# Altium schematic sheet FPGA_J3_J4.SchDoc
size A3; SheetNumber: 2; SheetTotal: 18
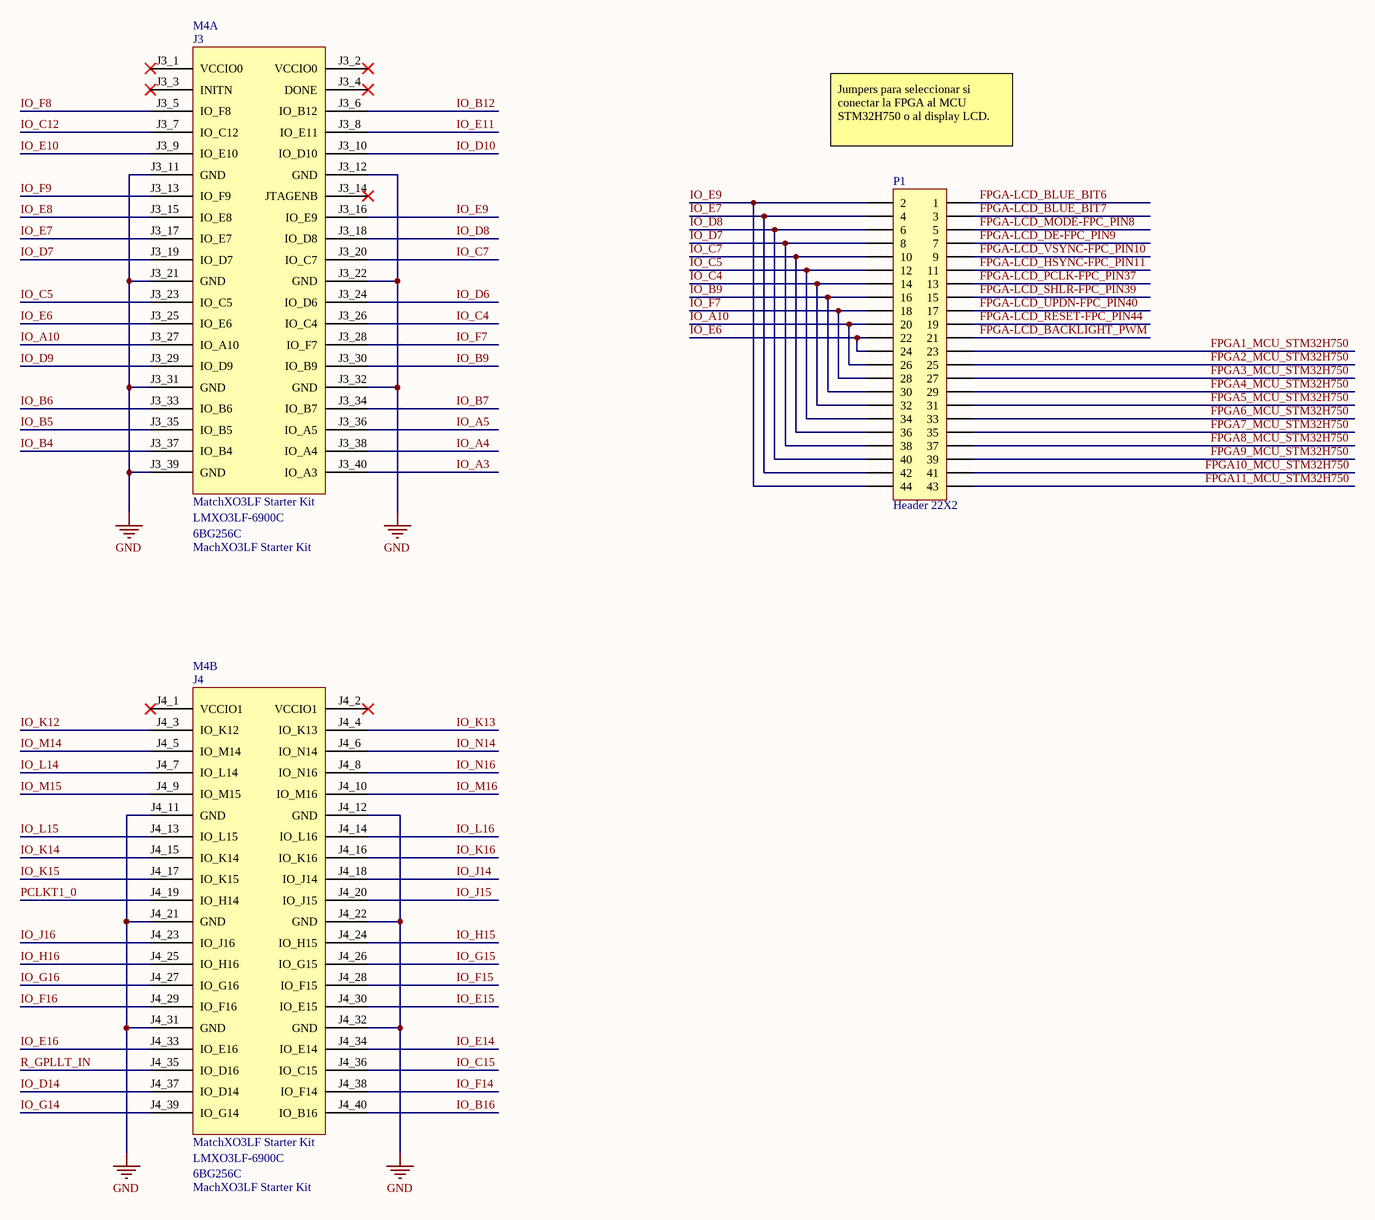
[diagram p0: FPGA_J3_J4.SchDoc]

## Parts
M4  MachXO3LF Starter Kit  [Lattice MachXO3LF starter kit]  (parts A,B of 4)
P1  Header 22X2  [HDR2X22]

## Nets
GND: M4.J3_11(GND) M4.J3_12(GND) M4.J3_21(GND) M4.J3_22(GND) M4.J3_31(GND) M4.J3_32(GND) M4.J3_39(GND) M4.J4_11(GND) M4.J4_12(GND) M4.J4_21(GND) M4.J4_22(GND) M4.J4_31(GND) M4.J4_32(GND)
FPGA1_MCU_STM32H750: P1.23
FPGA2_MCU_STM32H750: P1.25
FPGA3_MCU_STM32H750: P1.27
FPGA4_MCU_STM32H750: P1.29
FPGA5_MCU_STM32H750: P1.31
FPGA6_MCU_STM32H750: P1.33
FPGA7_MCU_STM32H750: P1.35
FPGA8_MCU_STM32H750: P1.37
FPGA9_MCU_STM32H750: P1.39
FPGA10_MCU_STM32H750: P1.41
FPGA11_MCU_STM32H750: P1.43
FPGA-LCD_BACKLIGHT_PWM: P1.21
FPGA-LCD_BLUE_BIT6: P1.1
FPGA-LCD_BLUE_BIT7: P1.3
FPGA-LCD_DE-FPC_PIN9: P1.7
FPGA-LCD_HSYNC-FPC_PIN11: P1.11
FPGA-LCD_MODE-FPC_PIN8: P1.5
FPGA-LCD_PCLK-FPC_PIN37: P1.13
FPGA-LCD_RESET-FPC_PIN44: P1.19
FPGA-LCD_SHLR-FPC_PIN39: P1.15
FPGA-LCD_UPDN-FPC_PIN40: P1.17
FPGA-LCD_VSYNC-FPC_PIN10: P1.9
IO_A3: M4.J3_40(IO_A3)
IO_A4: M4.J3_38(IO_A4)
IO_A5: M4.J3_36(IO_A5)
IO_A10: M4.J3_27(IO_A10) P1.20 P1.26
IO_B4: M4.J3_37(IO_B4)
IO_B5: M4.J3_35(IO_B5)
IO_B6: M4.J3_33(IO_B6)
IO_B7: M4.J3_34(IO_B7)
IO_B9: M4.J3_30(IO_B9) P1.16 P1.30
IO_B12: M4.J3_6(IO_B12)
IO_B16: M4.J4_40(IO_B16)
IO_C4: M4.J3_26(IO_C4) P1.14 P1.32
IO_C5: M4.J3_23(IO_C5) P1.12 P1.34
IO_C7: M4.J3_20(IO_C7) P1.10 P1.36
IO_C12: M4.J3_7(IO_C12)
IO_C15: M4.J4_36(IO_C15)
IO_D6: M4.J3_24(IO_D6)
IO_D7: M4.J3_19(IO_D7) P1.8 P1.38
IO_D8: M4.J3_18(IO_D8) P1.6 P1.40
IO_D9: M4.J3_29(IO_D9)
IO_D10: M4.J3_10(IO_D10)
IO_D14: M4.J4_37(IO_D14)
IO_E6: M4.J3_25(IO_E6) P1.22 P1.24
IO_E7: M4.J3_17(IO_E7) P1.4 P1.42
IO_E8: M4.J3_15(IO_E8)
IO_E9: M4.J3_16(IO_E9) P1.2 P1.44
IO_E10: M4.J3_9(IO_E10)
IO_E11: M4.J3_8(IO_E11)
IO_E14: M4.J4_34(IO_E14)
IO_E15: M4.J4_30(IO_E15)
IO_E16: M4.J4_33(IO_E16)
IO_F7: M4.J3_28(IO_F7) P1.18 P1.28
IO_F8: M4.J3_5(IO_F8)
IO_F9: M4.J3_13(IO_F9)
IO_F14: M4.J4_38(IO_F14)
IO_F15: M4.J4_28(IO_F15)
IO_F16: M4.J4_29(IO_F16)
IO_G14: M4.J4_39(IO_G14)
IO_G15: M4.J4_26(IO_G15)
IO_G16: M4.J4_27(IO_G16)
IO_H15: M4.J4_24(IO_H15)
IO_H16: M4.J4_25(IO_H16)
IO_J14: M4.J4_18(IO_J14)
IO_J15: M4.J4_20(IO_J15)
IO_J16: M4.J4_23(IO_J16)
IO_K12: M4.J4_3(IO_K12)
IO_K13: M4.J4_4(IO_K13)
IO_K14: M4.J4_15(IO_K14)
IO_K15: M4.J4_17(IO_K15)
IO_K16: M4.J4_16(IO_K16)
IO_L14: M4.J4_7(IO_L14)
IO_L15: M4.J4_13(IO_L15)
IO_L16: M4.J4_14(IO_L16)
IO_M14: M4.J4_5(IO_M14)
IO_M15: M4.J4_9(IO_M15)
IO_M16: M4.J4_10(IO_M16)
IO_N14: M4.J4_6(IO_N14)
IO_N16: M4.J4_8(IO_N16)
PCLKT1_0: M4.J4_19(IO_H14)
R_GPLLT_IN: M4.J4_35(IO_D16)

Not connected (* = marked no-connect by the designer): M4 J3_1(VCCIO0)* J3_2(VCCIO0)* J3_3(INITN)* J3_4(DONE)* J3_14(JTAGENB)* J4_1(VCCIO1)* J4_2(VCCIO1)*

## Notes on the sheet
- Jumpers para seleccionar si conectar la FPGA al MCU STM32H750 o al display LCD.
- (in symbol Lattice_MachXO3LF_starter_kit, part A) J3; MatchXO3LF Starter Kit; LMXO3LF-6900C; 6BG256C
- (in symbol Lattice_MachXO3LF_starter_kit, part B) J4; MatchXO3LF Starter Kit; LMXO3LF-6900C; 6BG256C

## Library data of the parts
M4 = Lattice_MachXO3LF_starter_kit: FPGA development board - MachXO3LF Starter Kit
P1 = Header 22X2: Header, 22-Pin, Dual row; LatestRevisionDate: 17-Jul-2002; LatestRevisionNote: Re-released for DXP Platform.; Publisher: Altium Limited